# EasyEDA Pro project PET_LAB_PCB_Rev3.eprj, board PCB1
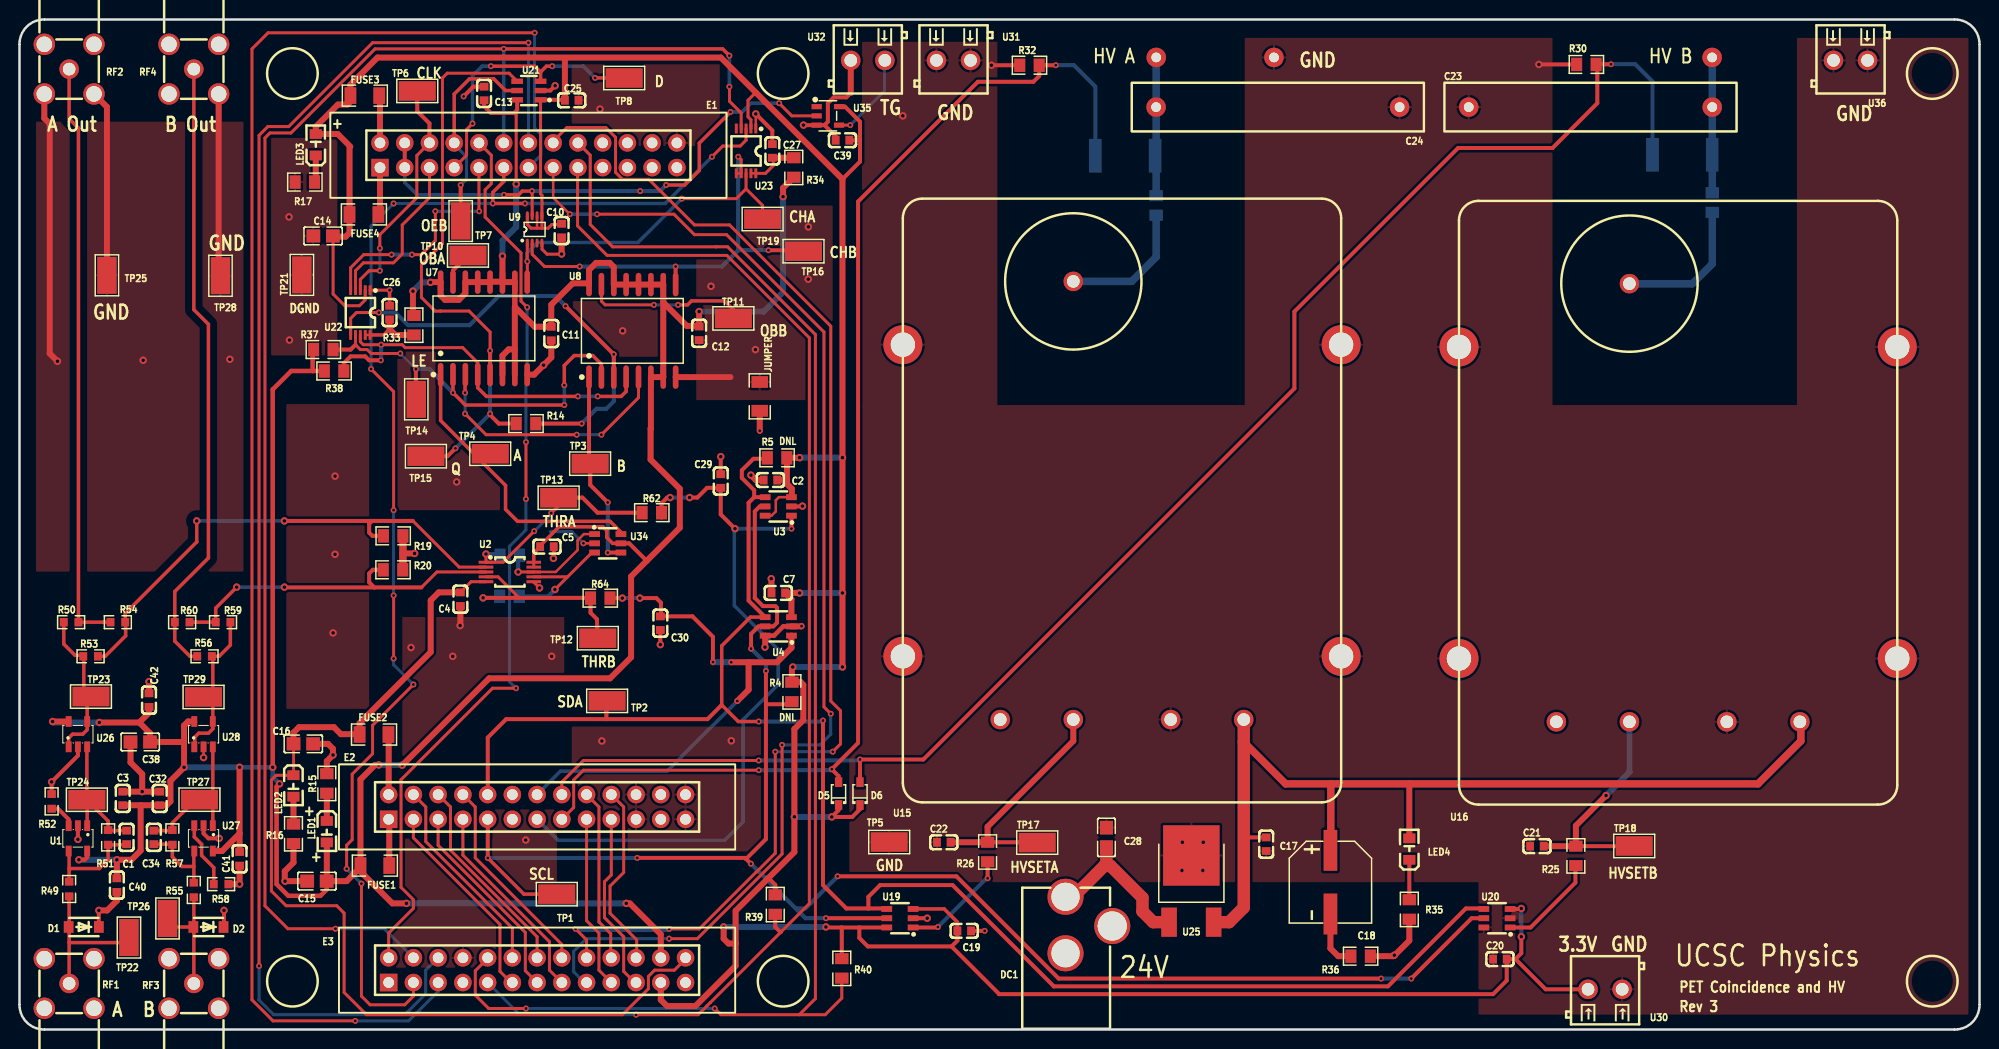
[diagram p4: board, top side]
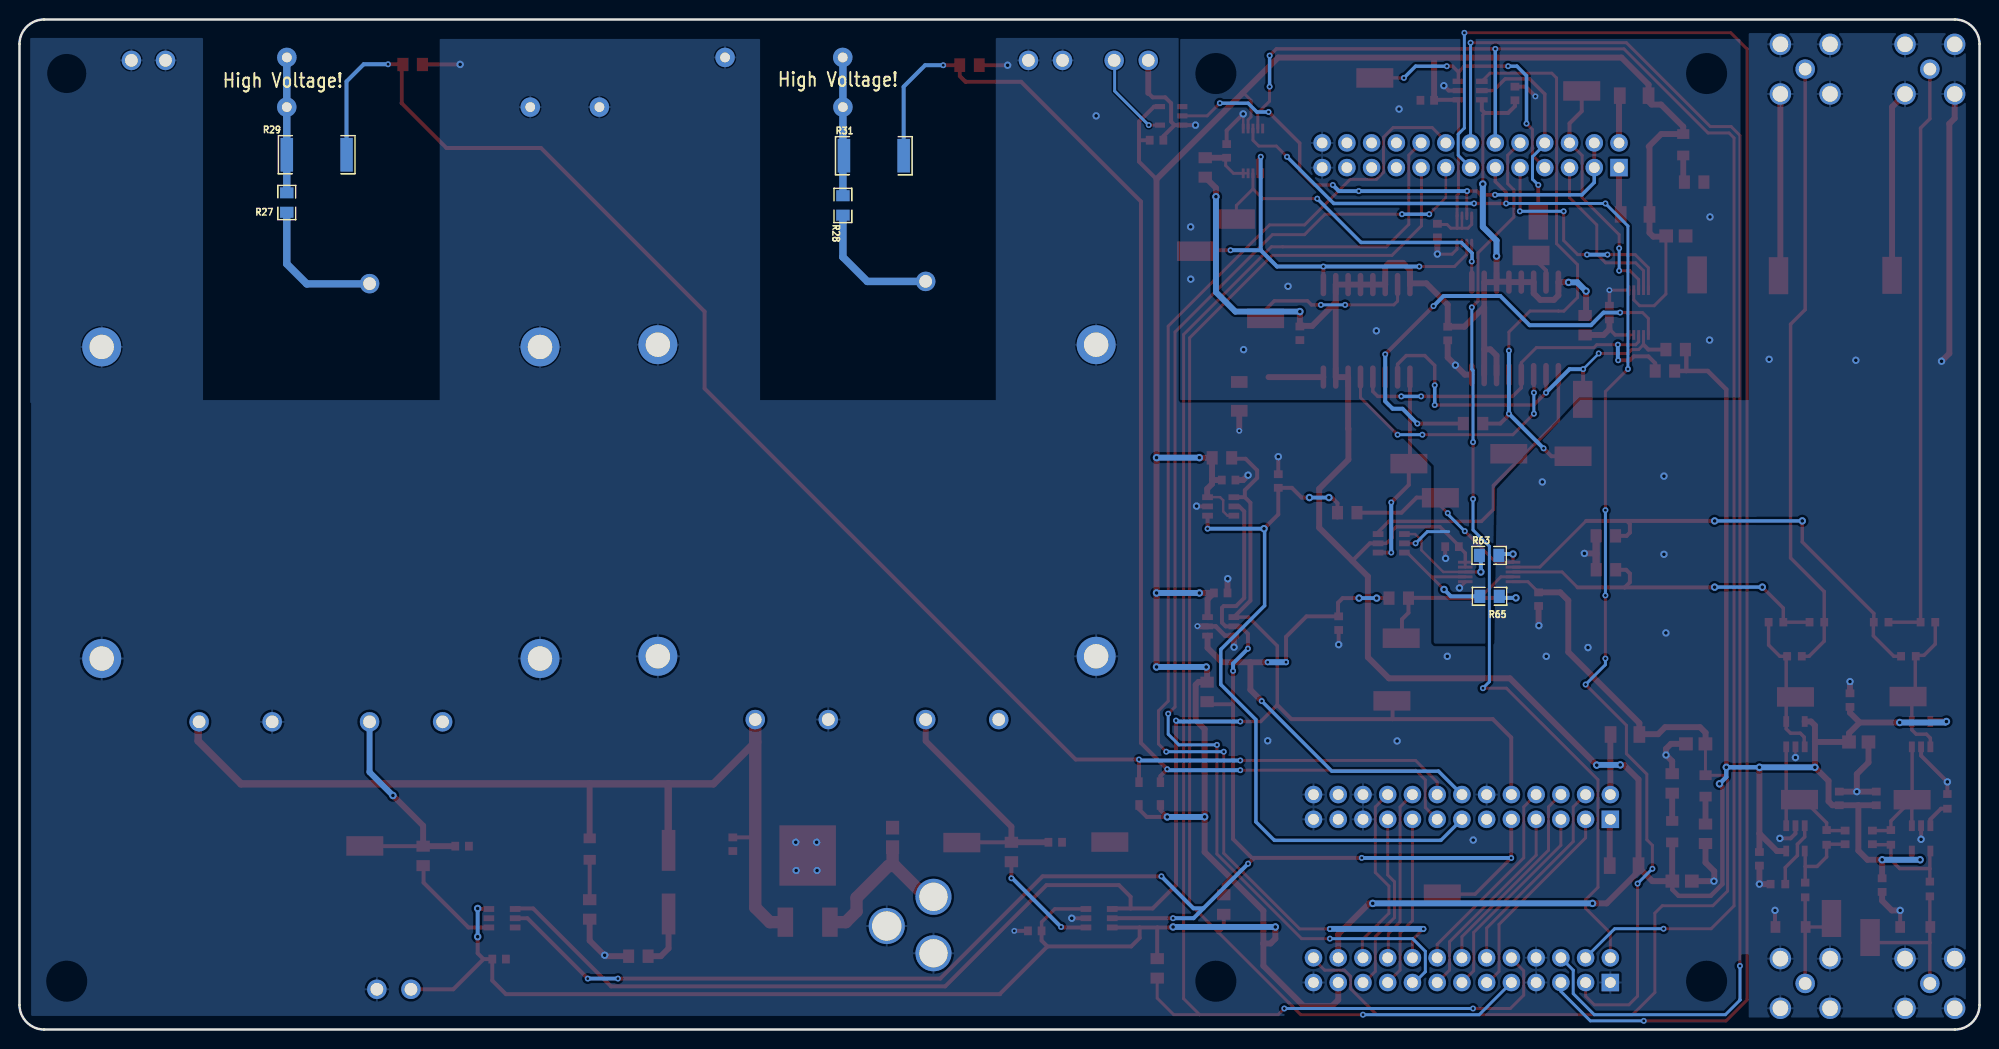
[diagram p5: board, bottom side, seen from below]

Outline 201.24 x 103.73 mm; copper layers: Top Layer, Bottom Layer. Coordinates in mm from the lower left corner of the outline.
Outline path: 0,101.19 arc(0.74,102.99) 2.54,103.73 198.7,103.73 arc(200.5,102.99) 201.24,101.19 201.24,2.54 arc(200.5,0.74) 198.7,0 2.54,0 arc(0.74,0.74) 0,2.54 0,101.19
Stack: Top Layer 0.035mm / Dielectric1 1.51mm FR4 er 4.5 / Bottom Layer 0.035mm

## Design rules (mm)
template: Custom Config
spacing copperThickness1oz (default): track to track 0.152, other pairs 0.152 to 0.3
spacing copperThickness2oz: track to track 0.203, other pairs 0.152 to 0.3
track width copperThickness1oz (default): min 0.127, default 0.254, max 2.54
track width copperThickness2oz: min 0.203, default 0.254, max 2.54
differential pair differentialPair (default): width min 0.127, default 0.254, max 2.54; gap min 0.152, default 0.152
via viaSize (default): diameter min 0.5, default 0.61, max 10; hole min 0.3, default 0.305, max 6.299
pour e4898 uses copperRegion

## Placement (name value [footprint] x y rotation side)
C1  5pF  [C0603]  11 19.73 90 top
C2  100nF  [C0603]  77.1 56.43 0 top
C3  100nF  [C0603]  10.6 23.73 90 top
C4  100nF  [C0603]  45.27 44.2 90 top
C5  100nF  [C0603]  54.16 49.59 180 top
C7  100nF  [C0603]  77.91 44.84 0 top
C10  100nF  [C0603]  55.66 82.05 270 top
C11  100nF  [C0603]  54.6 71.48 90 top
C12  100nF  [C0603]  69.78 71.5 90 top
C13  100nF  [C0603]  47.7 96.13 270 top
C14  1uF  [C0805]  31.18 81.5 0 top
C15  1uF  [C0805]  30.54 15.24 0 top
C16  1uF  [C0805]  29.14 29.34 180 top
C17  100nF  [C0603]  128 19.03 90 top
C18  220uF  [CAP-SMD_BD8.0-L8.3-W8.3-FD]  134.6 15.13 270 top
C19  100nF  [C0603]  97 10.13 180 top
C20  100nF  [C0603]  152 7.23 0 top
C21  100nF  [C0603]  155.8 18.83 0 top
C22  100nF  [C0603]  94.9 19.23 0 top
C23  0.068u  [HV_CAP_ECW-H12683JV]  161.3 94.73 0 top
C24  0.068u  [HV_CAP_ECW-H12683JV]  129.2 94.73 180 top
C25  100nF  [C0603]  56.7 95.43 180 top
C26  100nF  [C0603]  38 73.63 90 top
C27  100nF  [C0603]  77.3 90.23 270 top
C28  1uF  [C0805]  111.6 19.73 270 top
C29  100nF  [C0603]  72 56.33 270 top
C30  100nF  [C0603]  65.8 41.73 270 top
C32  100nF  [C0603]  14.4 23.73 270 top
C34  5pF  [C0603]  13.8 19.73 90 top
C38  1uF  [C0805]  12.4 29.53 0 top
C39  100nF  [C0603]  84.5 91.33 0 top
C40  100nF  [C0603]  10 14.83 270 top
C41  100nF  [C0603]  22.6 17.53 90 top
C42  100nF  [C0603]  13.3 33.83 270 top
D1  SM4007PL  [SOD-123F_L2.8-W1.8-LS3.7-RD]  6.6 10.53 180 top
D2  SM4007PL  [SOD-123F_L2.8-W1.8-LS3.7-RD]  19.4 10.53 180 top
D5  SS34  [SOD-323_L1.8-W1.3-LS2.5-RD]  84.1 24.23 90 top
D6  SS34  [SOD-323_L1.8-W1.3-LS2.5-RD]  86.3 24.23 90 top
DC1  694106301002  [DC-IN-TH_694106301002]  109.8 10.73 90 top
E1  3020-26-0100-00  [HDR-TH_26P-P2.54-V-M-R2-C13-S2.54]  52.26 89.79 0 top
E2  3020-26-0100-00  [HDR-TH_26P-P2.54-V-M-R2-C13-S2.54]  53.14 22.86 0 top
E3  3020-26-0100-00  [HDR-TH_26P-P2.54-V-M-R2-C13-S2.54]  53.14 6.1 0 top
FUSE1  0.5A  [R1206]  36.49 16.83 0 top
FUSE2  0.5A  [R1206]  36.4 30.3 180 top
FUSE3  0.5A  [R1206]  35.46 95.91 180 top
FUSE4  0.5A  [R1206]  35.36 83.71 0 top
JUMPER  3A  [R1206]  76 65.02 270 top
LED1  LG R971-KN-1-0-20-R18  [LED0805-RD_GREEN]  31.55 20.32 270 top
LED2  LG R971-KN-1-0-20-R18  [LED0805-RD_GREEN]  28.13 25.02 270 top
LED3  LG R971-KN-1-0-20-R18  [LED0805-RD_GREEN]  30.42 90.86 90 top
LED4  LG R971-KN-1-0-20-R18  [LED0805-RD_GREEN]  142.7 18.53 90 top
NOREF  -  [Pad_e1559]  128.8 99.83 0 top
NOREF#2  -  [Pad_e1592]  173.79 99.83 0 top
NOREF#3  -  [Pad_e1590]  116.72 99.83 0 top
R4  2.8kΩ  [R0805]  79.31 34.67 270 top
R5  2.8kΩ  [R0805]  77.78 58.71 180 top
R14  2.8kΩ  [R0805]  52 62.23 180 top
R15  330Ω  [R0805]  31.55 25.27 270 top
R16  330Ω  [R0805]  28.13 20.1 90 top
R17  330Ω  [R0805]  29.3 87.03 0 top
R19  50Ω  [R0805]  38.37 50.7 0 top
R20  50Ω  [R0805]  38.35 47.22 0 top
R25  2.8kΩ  [R0805]  159.8 17.83 90 top
R26  2.8kΩ  [R0805]  99.4 18.23 90 top
R27  1.5k  [R0805]  173.8 84.93 90 bottom
R28  1.5k  [R0805]  116.7 84.63 90 bottom
R29  10MegΩ  [R2512]  170.73 89.84 180 bottom
R30  10.2kΩ  [R0805]  160.88 99.11 0 top
R31  10MegΩ  [R2512]  113.53 89.74 180 bottom
R32  10.2kΩ  [R0805]  103.7 99.03 0 top
R33  2.8kΩ  [R0805]  40.5 72.33 270 top
R34  2.8kΩ  [R0805]  79.5 88.53 270 top
R35  1.5k  [R0805]  142.7 12.33 90 top
R36  0.5  [R0805]  137.7 7.53 180 top
R37  2.8kΩ  [R0805]  31.2 69.83 0 top
R38  2.8kΩ  [R0805]  32.3 67.63 0 top
R39  374  [R0805]  77.6 12.83 90 top
R40  374  [R0805]  84.43 6.28 270 top
R49  50Ω  [R0603]  5.1 14.43 90 top
R50  50Ω  [R0603]  5.3 41.83 0 top
R51  1kΩ  [R0603]  9.1 19.73 90 top
R52  50Ω  [R0603]  3.3 23.43 270 top
R53  50Ω  [R0603]  7.3 38.33 0 top
R54  50Ω  [R0603]  10.1 41.83 180 top
R55  50Ω  [R0603]  17.9 14.33 90 top
R56  50Ω  [R0603]  19 38.33 180 top
R57  1kΩ  [R0603]  15.7 19.73 90 top
R58  50Ω  [R0603]  20.7 14.93 180 top
R59  50Ω  [R0603]  20.9 41.83 180 top
R60  50Ω  [R0603]  16.7 41.83 180 top
R62  50Ω  [R0805]  64.92 53.08 180 top
R63  1.5k  [R0805]  50.35 48.69 180 bottom
R64  50Ω  [R0805]  59.63 44.31 180 top
R65  1.5k  [R0805]  50.31 44.49 0 bottom
RF1  -  [SMA-TH_BWSMA-KWE-Z001]  5.1 4.73 270 top
RF2  -  [SMA-TH_BWSMA-KWE-Z001]  5.1 98.63 90 top
RF3  -  [SMA-TH_BWSMA-KWE-Z001]  17.9 4.73 270 top
RF4  -  [SMA-TH_BWSMA-KWE-Z001]  17.9 98.63 90 top
TP1  5019  [CONN-SMD_5019]  55.16 13.9 180 top
TP2  5019  [CONN-SMD_5019]  60.33 33.75 0 top
TP3  5019  [CONN-SMD_5019]  58.59 58.12 0 top
TP4  5019  [CONN-SMD_5019]  48.34 59.13 0 top
TP5  5019  [CONN-SMD_5019]  89.29 19.25 180 top
TP6  5019  [CONN-SMD_5019]  40.84 96.39 0 top
TP7  5019  [CONN-SMD_5019]  45.3 83.03 90 top
TP8  5019  [CONN-SMD_5019]  62.09 97.72 180 top
TP10  5019  [CONN-SMD_5019]  46.05 79.49 0 top
TP11  5019  [CONN-SMD_5019]  73.3 73.03 0 top
TP12  5019  [CONN-SMD_5019]  59.38 40.19 0 top
TP13  5019  [CONN-SMD_5019]  55.36 54.61 0 top
TP14  5019  [CONN-SMD_5019]  40.74 64.72 90 top
TP15  5019  [CONN-SMD_5019]  41.73 58.88 0 top
TP16  5019  [CONN-SMD_5019]  80.5 79.93 0 top
TP17  5019  [CONN-SMD_5019]  104.49 19.2 0 top
TP18  5019  [CONN-SMD_5019]  165.79 18.85 0 top
TP19  5019  [CONN-SMD_5019]  76.3 83.23 0 top
TP21  5019  [CONN-SMD_5019]  28.99 77.5 90 top
TP22  5019  [CONN-SMD_5019]  11.24 9.45 90 top
TP23  5019  [CONN-SMD_5019]  7.34 34.19 0 top
TP24  5019  [CONN-SMD_5019]  6.92 23.6 0 top
TP25  5019  [CONN-SMD_5019]  8.98 77.45 90 top
TP26  5019  [CONN-SMD_5019]  15.2 11.41 90 top
TP27  5019  [CONN-SMD_5019]  18.48 23.61 0 top
TP28  5019  [CONN-SMD_5019]  20.64 77.41 90 top
TP29  5019  [CONN-SMD_5019]  18.9 34.15 0 top
U1  OPA354AIDBVT  [SOT-23-5_L3.0-W1.7-P0.95-LS2.8-BR]  6 19.63 90 top
U2  LT1715CMS#PBF  [MSOP-10_L3.0-W3.0-P0.50-LS5.0-TL]  50.35 46.99 0 top
U3  MCP4725A3T-E/CH  [SOT-23-6_L2.9-W1.6-P0.95-LS2.8-BR]  77.91 53.72 0 top
U4  MCP4725A3T-E/CH  [SOT-23-6_L2.9-W1.6-P0.95-LS2.8-BR]  77.91 41.4 0 top
U7  DS1023S-100+  [SOIC-16_L10.3-W7.5-P1.27-LS10.4-BL]  47.68 72.01 0 top
U8  DS1023S-100+  [SOIC-16_L10.3-W7.5-P1.27-LS10.4-BL]  62.92 71.76 0 top
U9  74LVC2G08DC,125  [VSSOP-8_L2.3-W2.0-P0.50-LS3.1-BL]  52.89 82.17 0 top
U15  C9619-50  [HPK_C9619-50]  113.2 54.33 90 top
U16  C9619-50  [HPK_C9619-50]  170.3 54.1 90 top
U19  MCP4725A0T-E/CH  [SOT-23-6_L2.9-W1.6-P0.95-LS2.8-BR]  90.4 11.43 0 top
U20  MCP4725A0T-E/CH  [SOT-23-6_L2.9-W1.6-P0.95-LS2.8-BR]  151.7 11.43 0 top
U21  TXU0101DBVR  [SOT-23-6_L2.9-W1.6-P0.95-LS2.8-BL-1]  52.3 96.43 90 top
U22  NVT2003DP,118  [TSSOP-10_L3.0-W3.0-P0.50-LS4.9-BL]  35 73.63 180 top
U23  NVT2003DP,118  [TSSOP-10_L3.0-W3.0-P0.50-LS4.9-BL]  74.6 90.23 180 top
U25  AS7815ADTR-G1  [TO-252-2_L6.6-W6.1-P4.57-LS9.9-BR-CW]  120.32 14.45 270 top
U26  OPA354AIDBVT  [SOT-23-5_L3.0-W1.7-P0.95-LS2.8-BR]  6 30.33 270 top
U27  OPA354AIDBVT  [SOT-23-5_L3.0-W1.7-P0.95-LS2.8-BR]  18.9 19.63 90 top
U28  OPA354AIDBVT  [SOT-23-5_L3.0-W1.7-P0.95-LS2.8-BR]  18.9 30.33 270 top
U30  OSTTE020104  [CONN-TH_2P-P3.50_OSTTE020104]  162.8 4.13 0 top
U31  OSTTE020104  [CONN-TH_2P-P3.50_OSTTE020104]  95.9 99.53 180 top
U32  OSTTE020104  [CONN-TH_2P-P3.50_OSTTE020104]  87.1 99.53 180 top
U34  SN74LVC2G04DBVT  [SOT-23-6_L2.9-W1.6-P0.95-LS2.8-BR]  60.4 49.93 180 top
U35  SN74LVC1G34DBVT  [TSOT-23-5_L2.9-W1.6-P0.95-LS2.8-BL]  83 93.83 270 top
U36  OSTTE020104  [CONN-TH_2P-P3.50_OSTTE020104]  188 99.53 180 top

## Footprints (pads in the part's own frame, mm; a bottom-side part is the same pattern mirrored in y, then rotated)
C0603
  rect 0.8x0.9 smd: 1(-0.7,0) 2(0.7,0)
C0805
  rect 1.41x1.35 smd: 1(-1,0) 2(1,0)
CAP-SMD_BD8.0-L8.3-W8.3-FD
  rect 4.2x1.4 smd: 1(-3.267,0) 2(3.267,0)
CONN-SMD_5019
  rect 3.8x2 smd: 1(0,0)
CONN-TH_2P-P3.50_OSTTE020104
  round 2 hole 1.3: 1(-1.75,0) 2(1.75,0)
DC-IN-TH_694106301002
  round 3.7 hole 2.9x3: 1(2.9,2.4) 2(-2.9,2.4)
  round 3.7 hole 3x2.9: 3(-0.1,-2.4)
HDR-TH_26P-P2.54-V-M-R2-C13-S2.54
  rect 1.8x1.8 hole 1.1: 1(-15.24,-1.27)
  round 1.8 hole 1.1: 2(-15.24,1.27) 3(-12.7,-1.27) 4(-12.7,1.27) 5(-10.16,-1.27) 6(-10.16,1.27) 7(-7.62,-1.27) 8(-7.62,1.27) 9(-5.08,-1.27) 10(-5.08,1.27) 11(-2.54,-1.27) 12(-2.54,1.27) 13(0,-1.27) 14(0,1.27) 15(2.54,-1.27) 16(2.54,1.27) 17(5.08,-1.27) 18(5.08,1.27) 19(7.62,-1.27) 20(7.62,1.27) 21(10.16,-1.27) 22(10.16,1.27) 23(12.7,-1.27) 24(12.7,1.27) 25(15.24,-1.27) 26(15.24,1.27)
HPK_C9619-50
  round 2 hole 1.3: 1(-22.5,-12.5) 2(-22.5,-5) 3(-22.5,5) 4(-22.5,12.5) 5(22.5,5)
  round 4 hole 2.5: 6(-16,-22.5) 7(16,-22.5) 8(-16,22.5) 9(16,22.5)
HV_CAP_ECW-H12683JV
  round 2 hole 1: 1(-12.5,0) 2(12.5,0)
LED0805-RD_GREEN
  rect 1x1.25 smd: 1(-1.1,0) 2(1.1,0)
MSOP-10_L3.0-W3.0-P0.50-LS5.0-TL
  rect 1.5x0.305 smd: 1(-2.451,1) 2(-2.451,0.5) 3(-2.451,0) 4(-2.451,-0.5) 5(-2.451,-1) 6(2.451,-1) 7(2.451,-0.5) 8(2.451,0) 9(2.451,0.5) 10(2.451,1)
Pad_e1559
  round 2 hole 1: 1(0,0)
Pad_e1590
  round 2 hole 1: 1(0,0)
Pad_e1592
  round 2 hole 1: 1(0,0)
R0603
  rect 0.806x0.864 smd: 1(-0.753,0) 2(0.753,0)
R0805
  rect 1.133x1.377 smd: 1(-1,0) 2(1,0)
R1206
  rect 1.208x1.701 smd: 1(-1.479,0) 2(1.479,0)
R2512
  rect 1.282x3.456 smd: 1(-3.067,0) 2(3.067,0)
SMA-TH_BWSMA-KWE-Z001
  round 2.2 hole 1.6: 1(-2.55,-2.55) 2(-2.55,2.55) 3(2.55,2.55) 4(2.55,-2.55)
  round 2 hole 1.3: 5(0,0)
SOD-123F_L2.8-W1.8-LS3.7-RD
  rect 1x1.2 smd: 1(-1.55,0) 2(1.55,0)
SOD-323_L1.8-W1.3-LS2.5-RD
  rect 1x0.75 smd: 1(-1.173,0) 2(1.173,0)
SOIC-16_L10.3-W7.5-P1.27-LS10.4-BL
  oval 0.574x2.401 smd: 1(-4.445,-4.75) 2(-3.175,-4.75) 3(-1.905,-4.75) 4(-0.635,-4.75) 5(0.635,-4.75) 6(1.905,-4.75) 7(3.175,-4.75) 8(4.445,-4.75) 9(4.445,4.75) 10(3.175,4.75) 11(1.905,4.75) 12(0.635,4.75) 13(-0.635,4.75) 14(-1.905,4.75) 15(-3.175,4.75) 16(-4.445,4.75)
SOT-23-5_L3.0-W1.7-P0.95-LS2.8-BR
  rect 1.1x0.6 smd: 1(1.3,-0.95) 2(1.3,0) 3(1.3,0.95) 4(-1.3,0.95) 5(-1.3,-0.95)
SOT-23-6_L2.9-W1.6-P0.95-LS2.8-BL-1
  rect 0.55x1.2 smd: 1(-0.95,-1.2) 2(0,-1.2) 3(0.95,-1.2) 4(0.95,1.2) 5(0,1.2) 6(-0.95,1.2)
SOT-23-6_L2.9-W1.6-P0.95-LS2.8-BR
  rect 1.1x0.6 smd: 1(1.35,-0.95) 2(1.35,0) 3(1.35,0.95) 4(-1.35,0.95) 5(-1.35,0) 6(-1.35,-0.95)
TO-252-2_L6.6-W6.1-P4.57-LS9.9-BR-CW
  rect 3x1.6 smd: 1(3.424,-2.29) 3(3.424,2.29)
  rect 6.2x5.8 smd: 2(-3.424,0)
TSOT-23-5_L2.9-W1.6-P0.95-LS2.8-BL
  rect 0.532x1.045 smd: 1(-0.95,-1.147) 2(0,-1.147) 3(0.95,-1.147) 4(0.95,1.147) 5(-0.95,1.147)
TSSOP-10_L3.0-W3.0-P0.50-LS4.9-BL
  rect 0.299x1 smd: 1(-1,-2.3) 2(-0.5,-2.3) 3(0,-2.3) 4(0.5,-2.3) 5(1,-2.3) 6(1,2.3) 7(0.5,2.3) 8(0,2.3) 9(-0.5,2.3) 10(-1,2.3)
VSSOP-8_L2.3-W2.0-P0.50-LS3.1-BL
  oval 0.305x0.905 smd: 1(-0.75,-1.403) 2(-0.25,-1.403) 7(-0.25,1.403) 8(-0.75,1.403)
  oval 0.28x0.905 smd: 3(0.25,-1.403) 4(0.75,-1.403) 5(0.75,1.403) 6(0.25,1.403)

## Nets
As in the schematic, except:
AGND: C2.1 C3.2 C4.1 C7.1 C15.1 C16.1 C17.1 C19.1 C20.1 C21.1 C22.1 C23.1 C24.1 C28.1 C29.1 C30.2 C32.1 C38.1 C40.2 C41.1 C42.1 D1.1 D2.1 DC1.2 DC1.3 E2.12 E2.21 E2.22 E2.25 E2.26 E3.1 E3.7 E3.8 E3.25 JUMPER.2 NOREF.1 R15.1 R16.1 R19.2 R20.2 R30.1 R32.1 R35.1 R36.1 R52.1 R58.1 RF1.1 RF1.2 RF1.3 RF1.4 RF2.1 RF2.2 RF2.3 RF2.4 RF3.1 RF3.2 RF3.3 RF3.4 RF4.1 RF4.2 RF4.3 RF4.4 TP5.1 TP25.1 TP28.1 U1.2 U3.2 U4.2 U4.6 U15.2 U15.6 U15.7 U15.8 U15.9 U16.2 U16.6 U16.7 U16.8 U16.9 U19.2 U20.2 U20.6 U25.2 U26.2 U27.2 U28.2 U30.2 U31.1 U31.2 U36.1 U36.2
HVOUTA: C24.2 NOREF#3.1 R28.2 R31.1
HVOUTB: C23.2 NOREF#2.1 R27.2 R29.1

Pads without a net: E1 19 20 21 22 23 24; E2 11 23 24; U9 3; U15 4; U16 4; U23 5; U35 1

## Via types
v1: diameter 0.762, hole 0.381, Top Layer to Bottom Layer, 100 vias
v2: diameter 0.61, hole 0.305, Top Layer to Bottom Layer, 114 vias

## Routing (per net, layer and track width the routed paths; a pad name or vN(x,y) marks a point on that pad's centre or on a via; arc(x,y) is an arc through that point)
AGND: length 147.1
  Top Layer w0.254: U28.2 v1(18.9,27.93)
  Top Layer w0.406: U26.2 6,28.13 v1(3.3,25.43) R52.1 ; R30.1 v1(156,99.11) ; D2.1 21,10.58 v1(21,12.23) ; C29.1 v1(72,58.83) ; C19.1 v2(99.1,10.13) ; D1.1 v1(8.15,12.23) ; R32.1 v1(99.79,99.03) ; v1(80.39,53.75) 80.36,53.72 U3.2 ; U1.2 v1(6,19.53) ; C30.2 v1(65.8,39.53) ; U27.2 18.9,20.13 19.4,19.63 v1(20.5,19.63) ; U19.2 v1(93.2,11.43)
  Top Layer w0.457: U4.6 77.47,40.45 78.42,41.4 U4.2
  Top Layer w0.61: v1(45.24,41.49) 45.27,41.52 C4.1 ; v1(3.9,68.63) 3.1,69.43 3.1,93.03 2.55,93.58 RF2.2 ; U4.2 80.27,41.4 v2(80.3,41.43) ; TP25.1 8.98,94.75 RF2.1 ; R58.1 v1(22.6,14.93) C41.1 ; v1(40.57,48.9) 39.41,48.9 39.37,48.85 ; C38.1 11.4,27.43 12.6,26.23 v1(12.6,24.43) ; v2(76,61.5) JUMPER.2 ; RF4.1 20.45,77.6 TP28.1 ; C16.1 31.68,29.34 32.19,28.83 v1(32.19,28.19) 31.55,27.56 R15.1 ; C42.1 v1(13.3,35.73) ; C7.1 77.21,46.27 v1(77.19,46.3) ; R36.1 141.06,7.53 v1(141.16,7.63) 141.2,7.63 142.7,9.13 R35.1 ; R16.1 28.13,17.15 27.24,16.26 27.24,15.27 v1(27.27,15.24) C15.1 ; C3.2 v1(12.6,24.43) ; v1(12.6,24.43) C32.1 ; U4.6 76.56,39.29 v1(76.54,39.27) ; 112,10.83 DC1.3 ; C40.2 10,13.23 9,12.23 v1(8.15,12.23) ; v1(75.1,56.93) 75.6,56.43 C2.1
  Top Layer w0.762: R19.2 39.37,47.23 R20.2
  vias: v1(12.7,68.73) v1(21.6,68.83) v1(32.2,40.73) v1(32.4,56.83) v1(32.4,48.81) v1(40.2,39.23) v1(44.48,38.33) v1(44.89,56.24) v1(51.98,19.46) v1(54.64,38.33) v1(59.8,29.63) v1(73.08,29.65) v1(90.7,93.83) v1(119.4,19.23) v1(119.36,16.33) v1(121.54,19.23) v1(121.5,16.33)
DGND: length 48
  Top Layer w0.254: U34.2 v2(57.9,49.93) ; v1(75.6,94.03) U23.1
  Top Layer w0.305: v2(38,75.93) U22.1 ; U9.4 53.65,80.75 53.65,80.14 54.16,79.63 55.65,79.63 v1(55.66,79.64) ; U2.6 52.8,45.94 v1(53.4,45.35)
  Top Layer w0.355: 38,74.53 v2(38,75.93)
  Top Layer w0.406: 82.65,92.88 83,93.23 83,95.13 83.6,95.73 84.9,95.73 85.35,96.18 ; 82.65,92.88 83.8,91.73 C39.1 ; 82.65,92.88 U35.3 v1(80.5,92.88) ; C27.1 77.3,92.33 v1(75.6,94.03) ; C5.1 54.86,48.42 v1(54.82,48.39) ; U21.2 54.5,96.43 v1(55,96.93) ; v2(45.6,95.83) 46.6,96.83 C13.1
  Top Layer w0.61: 52.13,67.26 52.84,67.26 v1(53.81,68.23) 54.6,69.02 54.6,70.77 C11.1 ; 85.35,96.18 U32.2 ; C10.2 v1(55.66,79.64) ; U8.8 73,67
  Bottom Layer w0.305: 54.5,51.13 56.7,51.13 v2(57.9,49.93)
  vias: v1(27.67,83.45) v1(27.72,70.81) v1(59.6,94.53) v1(61.93,71.76) v1(71,76.33) v1(75.56,69.82) v1(81,82.43) v1(80.99,77.06)
V3P3: length 385.9
  Top Layer w0.254: U3.3 77.97,54.67 77.66,54.36 77.66,53.21 77.21,52.77 U3.6 ; 53.64,85.67 53.65,85.68 ; U9.6 53.14,82.3 53.13,82.3
  Top Layer w0.305: U23.2 75.1,93.43 74.8,93.73 74.8,95.43 75.53,96.16 75.67,96.16 ; 53.63,82.3 52.52,82.3 52.14,82.68 U9.8 ; 53.63,82.3 53.64,82.31 U9.5 53.64,85.67 ; 53.63,82.3 54.29,82.3 54.67,82.68 55.59,82.68 C10.1 ; U21.1 53.5,85.83 53.65,85.68 ; 32.2,81.48 32.2,75.53 33.4,74.33 34.9,74.33 35.5,74.93 U22.2
  Top Layer w0.355: U19.3 91.75,12.38 94.95,12.38 96.3,11.03 C19.2
  Top Layer w0.406: R39.2 77.6,14.85 76.89,15.56 ; U30.1 156.7,4.13 153.6,7.23 ; v1(82.8,10.53) 82.85,10.48 84.41,10.48 ; C19.2 96.3,9.13 95.7,8.53 ; 84.41,10.48 84.43,10.46 R40.1 ; 84.41,10.48 86.23,10.48 ; 86.23,10.48 86.23,9.4 87.1,8.53 95.7,8.53 ; 86.23,10.48 U19.6 ; 84.5,87.33 86.3,89.13 86.3,91.34 ; 153.6,7.23 C20.2 152.7,5.03 151.3,3.63 100.57,3.63 100.57,3.66 95.7,8.53 ; 153.6,7.23 154.2,7.83 v1(154.2,9.53) ; U20.3 154.15,12.38 v1(154.2,12.43) ; U35.5 84.75,94.78 86.3,93.23 86.3,91.34 ; 86.3,91.34 86.29,91.33 C39.2 ; 84.1,23.16 84.1,22.53 v1(83.4,21.83) 85.5,21.83 86.3,22.63 86.3,23.16 ; U21.1 55.95,95.48
  Top Layer w0.61: C2.2 78.75,56.43 78.8,56.48 ; 79.3,54.71 79.3,55.53 78.8,56.03 78.8,56.48 ; 73.53,8.84 73.52,8.83 72.8,8.83 72.3,9.33 v1(72.3,10.53) ; 73.53,8.84 73.53,12.19 79.56,18.22 v1(79.56,21.84) 79.56,30.86 80.48,31.78 80.48,35.41 80.2,35.69 79.32,35.69 R4.1 79.31,37.08 ; 73.53,8.84 73.53,6.54 69.4,2.41 66.48,2.41 65.84,3.05 E3.23 ; 78.8,56.48 78.8,58.59 ; 33.89,90.68 33.89,81.82 33.5,81.43 32.24,81.43 C14.2 ; C25.2 56,99.63 ; U4.3 79.26,44.19 C7.2 80.09,44.84 v1(80.1,44.83) ; 33.97,90.68 32.68,91.96 LED3.2 30.42,92.72 32.7,95 33.67,95 33.98,95.31 33.98,97.04 36.76,99.82 72.01,99.82 84.5,87.33 v1(84.5,58.73) v1(84.5,44.83) v1(84.5,37.23) ; R5.1 80.08,58.71 v1(80.1,58.73)
  Bottom Layer w0.406: v1(154.2,12.43) v1(154.2,9.53)
  Bottom Layer w0.61: v1(84.5,58.73) v1(80.1,58.73) ; v1(84.5,37.23) v1(79.4,37.23) ; v1(84.5,44.83) v1(80.1,44.83) ; v1(79.56,21.84) 79.57,21.83 v1(83.4,21.83) ; v1(82.8,10.53) v1(72.3,10.53)
V4N: length 104.6
  Top Layer w0.305: U2.5 46.36,45.99 C4.2 ; E3.26 68.38,7.24 67.24,6.1 65.21,6.1 64.57,5.46 64.57,4.19 61.91,1.52 35.62,1.52 33.33,3.81 33.33,11.95 32.57,12.71 27.38,12.71 25.87,14.22 25.87,25.63 26.34,26.11 28.13,26.11 28.14,26.12 C16.2
  Top Layer w0.61: 45.27,44.89 43.05,44.89 42.22,44.07 42.22,38.77 34.92,31.47 FUSE2.2 ; 34.82,30.3 34.79,30.33 33,30.33 32.28,31.05 28.7,31.05 28.13,30.48 28.13,29.35 C16.2
V5: length 384.4
  Top Layer w0.305: 50.8,94.13 51,93.93 v1(51,86.83) ; U2.9 U2.10
  Top Layer w0.355: 53.46,49.59 52.8,48.94 U2.10 ; 53.46,49.69 55.4,51.63 59.9,51.63 60.3,51.23 60.3,50.53 60.9,49.93 U34.5
  Top Layer w0.406: v1(6.1,17.43) 6.7,17.43 6.95,17.68 U1.5 ; U21.6 51.1,94.43 50.8,94.13 48.4,94.13 47.7,94.83 C13.2 ; U34.5 62.6,49.93 64.4,48.13
  Top Layer w0.457: 30.1,67.63 30.1,69.73 R37.1 ; 30.1,67.63 R38.1 ; 30.1,67.63 27.9,67.63 26,65.73 v1(26,26.93) ; v1(26.7,25.23) 26.4,24.93 26.4,14.93 27.6,13.73 30.9,13.73 31.54,14.37 C15.2
  Top Layer w0.559: U7.10 50.86,74.17
  Top Layer w0.61: 12.44,23.03 C32.2 15.1,23.03 15.5,23.43 15.5,25.53 v1(16.9,26.93) 16.9,29.56 ; 12.44,23.03 12.44,18.37 11.5,17.43 v1(10,17.43) C40.1 ; 12.44,23.03 C3.1 ; 69.65,72.33 69.72,72.26 68.51,72.26 66.1,74.68 ; 22.6,20.13 C41.2 ; 22.6,20.13 v1(22.6,26.93) ; 22.6,20.13 20.8,18.33 U27.5 ; U7.11 49.55,76.8 48.36,76.8 U7.12 U7.13 U7.14 45.78,75.61 45.1,74.93 43.7,74.93 43.24,75.39 U7.16 42.23,76.76 v1(42.2,76.73) ; U7.11 U7.10 ; U7.11 v1(49.59,79.43) ; 66.1,74.68 66.1,76.51 U8.11 U8.12 U8.13 U8.14 61.02,78.31 60.6,78.73 59.2,78.73 58.48,78.01 U8.16 58.35,76.63 56.8,76.63 54.6,74.43 C11.2 52.89,72.18 50.88,74.19 50.86,74.17 U7.7 ; 66.1,74.68 66.1,67 U8.6 64.83,61.73 64.8,61.7 64.8,58.53 67.8,55.53 67.8,51.54 62.8,46.53 62.8,38.23 60.64,36.07 48.22,36.07 v1(39.3,27.15) ; U7.6 49.59,69.22 50.22,69.85 50.86,69.85 ; 16.9,29.56 16.9,31.23 17.3,31.63 U28.5 ; 16.9,29.56 16.87,29.53 C38.2 13.4,30.43 12.3,31.53 ; v1(3.4,31.63) U26.5 ; E3.24 65.84,9.78 62.67,12.95 v1(62.3,12.95) ; 34.92,16.57 33.59,15.24 C15.2 31.55,15.26 LED1.2 ; 12.3,31.53 13.3,32.53 C42.2 ; 12.3,31.53 v1(8.2,31.53) ; C12.2 v1(69.78,73.73) ; v1(39.73,12.95) 38.29,12.95 35.01,16.23 FUSE1.1 ; v1(36.89,27.18) 36.51,27.18 35.01,25.68 35.01,17.33 ; v1(40.4,75.83) 40.4,73.43 R33.1 ; R34.2 78.4,86.43 v1(78.4,85.53)
  Bottom Layer w0.457: v1(22.6,26.93) v1(26,26.93) 26,25.93 v1(26.7,25.23)
  Bottom Layer w0.61: v1(10,17.43) v1(6.1,17.43) ; v1(8.2,31.53) 3.5,31.53 v1(3.4,31.63) ; v1(42.2,76.73) 41.3,76.73 v1(40.4,75.83) ; v1(49.59,79.43) 49.59,81.02 51,82.43 v1(51,86.83) ; v1(39.3,27.15) 39.27,27.18 v1(36.89,27.18) ; v1(16.9,26.93) 22.5,26.93 22.6,26.83 ; v1(78.4,85.53) 78.4,75.73 76.4,73.73 v1(69.78,73.73) ; v1(39.73,12.95) v1(62.3,12.95)
V15: length 100.3
  Top Layer w0.406: C17.2 126,19.73
  Top Layer w0.61: LED4.2 142.7,25.2 142.73,25.23
  Top Layer w0.762: 134.64,25.23 134.64,18.44 C18.1 ; 134.64,25.23 130,25.23 125.7,29.53 ; 134.64,25.23 178.5,25.23 182.9,29.63 182.9,31.5 U16.1
  Top Layer w1.27: U15.1 125.7,12.53 124.19,11.03 U25.3
AIN2: length 130.7
  Top Layer w0.305: E2.15 56.9,22.81 56.9,25.63 57.9,26.63 v2(75.9,26.63)
  Top Layer w0.406: v2(106.4,99.03) R32.2 104.7,97.93 104.1,97.33 98.4,97.33 86.1,85.03 86.1,29.43 v2(83.4,26.73) 84.1,26.03 84.1,25.5
  Bottom Layer w0.406: v2(106.4,99.03) 108.26,99.03 110.46,96.83 110.46,90.24 ; v2(75.9,26.63) 83.3,26.63 v2(83.4,26.73)
AIN3: length 161.6
  Top Layer w0.305: E2.16 55.68,25.42 57.9,27.63 v2(75.9,27.63)
  Top Layer w0.406: v2(163.4,99.13) 161.9,99.13 R30.2 162,98.99 162,95.13 157.4,90.53 147.7,90.53 130.9,73.73 130.9,65.83 92.8,27.73 v2(86.3,27.73) 86.3,25.5
  Bottom Layer w0.406: 167.66,89.64 167.66,97.37 165.9,99.13 v2(163.4,99.13) ; v2(75.9,27.63) 86.2,27.63 v2(86.3,27.73)
AOUT0: length 17.8
  Top Layer w0.305: E2.17 58.22,11.18 59.49,9.91 59.49,6.1 E3.19
AOUT1: length 17.8
  Top Layer w0.305: E2.18 59.49,22.86 59.49,11.05 60.7,9.84 60.7,7.43 E3.20
AOUT2: length 18.5
  Top Layer w0.305: E3.21 63.18,4.83 62.03,5.97 62.03,9.53 60.07,11.49 60.07,15.18 60.76,15.88 E2.19
AOUT3: length 19
  Top Layer w0.305: E2.20 62.03,22.86 62.03,16.13 60.64,14.73 60.64,11.94 63.37,9.21 63.37,7.43 E3.22
CLK: length 40.2
  Top Layer w0.305: U22.8 35,70.63 35.3,70.33 v2(37.13,70.33) 39.3,70.33 39.6,70.03 45.5,70.03 47.05,68.48 U7.4
  Top Layer w0.355: v2(57.34,65.02) 47.94,65.02 47.05,65.91 U7.4 ; U8.4 62.29,65.53 61.78,65.02 v2(59.37,65.02)
  Top Layer w0.406: v2(37.1,68.73) 35.9,68.73 35.5,69.13 34,69.13 33.3,68.43 R38.2
  Bottom Layer w0.355: v2(57.34,65.02) v2(59.37,65.02)
  Bottom Layer w0.406: v2(37.1,68.73) 37.13,68.76 v2(37.13,70.33)
CS: length 21
  Top Layer w0.305: E3.14 53.14,9.53 44.25,18.41 44.25,22.86 E2.6
D: length 28.1
  Top Layer w0.305: E1.7 45.91,89.79 45.91,92.44 v2(46.51,93.05)
  Top Layer w0.355: TP8.1 62.08,97.73 v2(59.1,97.73) ; v2(48.4,98.93) 52.9,98.93 53.5,98.33 ; v2(54.7,98.93) 54.1,98.93 53.5,98.33 ; 53.5,98.33 U21.3
  Bottom Layer w0.355: v2(54.7,98.93) 57.9,98.93 v2(59.1,97.73) ; v2(48.4,98.93) 47.5,98.93 46.51,97.95 v2(46.51,93.05)
GPIO10: length 95.2
  Top Layer w0.305: E3.2 37.9,9.91 40.44,12.45 40.44,13.34 39.17,14.61 39.17,25.65 48.57,35.05 v2(50.99,35.05) ; v2(52,54.48) v2(52,60.33) ; E1.10 48.45,89.79 48.45,86.87 47.81,86.23 47.81,83.44 51.49,79.76 51.49,74.8 v2(52.13,74.17)
  Bottom Layer w0.305: v2(52,54.48) 52,51.31 50.32,49.63 50.32,35.71 v2(50.99,35.05) ; v2(52.13,74.17) 52.13,67.82 52,67.69 v2(52,60.33)
GPIO11: length 139.3
  Top Layer w0.305: v2(38.41,44.58) v2(38.41,38.1) ; v2(40.44,35.43) 36.25,31.24 36.25,28.32 34.16,26.23 34.16,19.49 33.59,18.92 v2(33.59,16.51) ; U23.3 74.6,91.33 74,90.73 72.2,90.73 v2(71.1,89.63) ; v2(35.11,14.99) 35.11,3.43 36,2.54 39.56,2.54 40.44,3.43 E3.3 ; v2(36.1,67.83) 38.41,65.52 v2(38.41,53.34)
  Top Layer w0.355: v2(51.9,84.84) v2(48.6,84.84) 48.6,85.97 49.72,87.09 E1.11
  Bottom Layer w0.305: v2(40.44,35.43) 38.41,37.47 v2(38.41,38.1) ; v2(33.59,16.51) v2(35.11,14.99) ; v2(48.6,84.84) v2(38.41,84.84) 36.1,82.52 v2(36.1,67.83) ; v2(38.41,53.34) v2(38.41,44.58)
  Bottom Layer w0.355: v2(71.1,89.63) 66.3,84.84 v2(51.9,84.84)
GPIO12: length 165.7
  Top Layer w0.305: U23.4 74.1,94.13 72.9,95.33 72.9,96.82 v2(72.89,96.83) ; v2(32.44,10.35) 27.55,10.35 25.2,12.7 25.2,91.57 25.71,92.08 27.87,92.08 36.51,100.71 v2(49.72,100.71)
  Top Layer w0.355: v2(49.72,100.71) 72.2,100.71 v2(72.89,100.02)
  Bottom Layer w0.305: E3.4 37.46,10.35 v2(32.44,10.35)
  Bottom Layer w0.355: E1.12 v2(49.72,100.71) ; v2(72.89,100.02) v2(72.89,96.83)
GPIO13: length 164.2
  Top Layer w0.305: v2(52.89,102.36) 25.52,102.36 23.87,100.71 23.87,3.05 26.03,0.89 v2(34.48,0.89)
  Bottom Layer w0.305: E3.5 42.98,3.92 39.96,0.89 v2(34.48,0.89) ; E1.13 53.53,89.79 53.53,91.95 52.89,92.58 v2(52.89,102.36)
GPIO14: length 153.6
  Top Layer w0.305: v2(24.6,6.53) 24.6,91.83 25.5,92.73 27.64,92.73 36.25,101.35 v2(52.26,101.35)
  Bottom Layer w0.305: E3.6 41.71,6.1 41.71,3.68 39.56,1.52 26.09,1.52 24.57,3.05 24.6,3.08 v2(24.6,6.53) ; E1.14 v2(52.26,101.35)
GPIO15: length 124.3
  Top Layer w0.254: E1.15 54.8,85.44 v2(56.5,83.73)
  Top Layer w0.305: v2(78.3,29.23) 78.3,18.03 69.6,9.33 v2(66.7,9.33) ; v2(83.3,32.43) 82.6,33.13 82.6,71.63 72.6,81.63 69.3,81.63 67.2,83.73 v2(59.3,83.73)
  Bottom Layer w0.305: E3.17 58.01,4.83 56.9,5.93 56.9,8.03 58.2,9.33 v2(66.7,9.33) ; v2(78.3,29.23) 82.2,29.23 83.3,30.33 v2(83.3,32.43)
  Bottom Layer w0.355: v2(59.3,83.73) v2(56.5,83.73)
GPIO16: length 127.7
  Top Layer w0.305: v2(57.1,10.33) 58.22,9.21 E3.18 ; E1.16 54.8,91.23 56.2,92.63 60.2,92.63 61.2,91.63 61.2,88.03 61.92,87.31 64.62,87.31 69.3,82.63 72.9,82.63 83.3,72.23 83.3,33.73 84.3,32.73 84.3,29.33 v2(83.5,28.53) ; v2(66.7,10.33) 69.8,10.33 75.62,16.15 75.64,16.15 77.6,18.11 v2(77.6,28.53)
  Bottom Layer w0.305: v2(83.5,28.53) v2(77.6,28.53)
  Bottom Layer w0.61: v2(66.7,10.33) v2(57.1,10.33)
GPIO17: length 133.9
  Top Layer w0.305: v2(63.3,1.52) 69.69,1.52 70.57,2.4 70.57,2.41 70.93,2.77 70.94,2.77 78.16,9.99 81.1,12.93 81.1,71.03 72.63,79.5 60.33,79.5 57.3,82.53 57.3,88.48 E1.17
  Top Layer w0.406: 78.16,9.99 78.14,9.99 77.6,10.53 R39.1
  Bottom Layer w0.305: E3.9 51.37,1.52 v2(63.3,1.52)
GPIO18: length 152.8
  Top Layer w0.305: R40.2 84.43,3.22 82.73,1.52 80.07,1.52 ; E1.18 58.6,89.8 58.6,82.68 60.9,80.38 71.55,80.38 71.55,80.39 72.7,80.39 81.72,71.37 81.72,3.18 80.07,1.52 ; v2(71.38,2.16) 72.01,1.52 80.07,1.52 ; v2(52,2.16) 48.17,2.16 46.8,3.53 46.8,6.03 48.06,7.3 E3.10
  Bottom Layer w0.305: v2(71.38,2.16) v2(52,2.16)
HVOUTA: length 13.9
  Bottom Layer w0.762: R31.1 116.7,89.64 R28.2 ; 116.7,90.13 C24.2 116.7,99.81 NOREF#3.1
HVOUTB: length 13.8
  Bottom Layer w0.762: R27.2 173.8,89.84 R29.1 ; NOREF#2.1 173.8,99.82 C23.2 173.8,89.93
INA: length 53.2
  Top Layer w0.305: 40.4,52.23 45.14,47.49 U2.2
  Top Layer w0.355: v1(18.2,52.23) 18.2,50.08 10.85,42.73 R54.1 10.9,41.79 10.9,40.43 8.8,38.33 R53.2
  Top Layer w0.406: 36.2,52.23 40.4,52.23 ; 36.2,52.23 35.9,51.93 35.9,51.03 36.23,50.7 R19.1 ; 36.2,52.23 v1(27.2,52.23)
  Bottom Layer w0.355: v1(18.2,52.23) v1(27.2,52.23)
INB: length 36.7
  Top Layer w0.305: U2.3 42.86,46.99 41.27,45.4
  Top Layer w0.355: v1(22.3,45.43) 20.15,43.28 R59.2 R60.1
  Top Layer w0.406: 41.27,45.4 36.43,45.4 ; 36.43,45.4 35.9,45.93 35.9,46.83 36.28,47.22 R20.1 ; 36.43,45.4 27.23,45.4 v1(27.2,45.43)
  Bottom Layer w0.355: v1(22.3,45.43) v1(27.2,45.43)
LE: length 42.5
  Top Layer w0.305: v2(39.1,69.43) 36.1,69.43 35.7,69.83 35,69.83 34.5,70.33 U22.7
  Top Layer w0.355: v2(55.94,66.17) 55.94,68.2 56.95,69.22 58.86,69.22 59.75,68.33 U8.2 ; v2(55.94,64.14) 45.78,64.14 v2(44.51,65.41) U7.2
  Top Layer w0.406: 34.5,70.33 34,69.83 R37.2 ; v2(40.7,67.82) 40.7,64.76 TP14.1
  Bottom Layer w0.254: v2(39.1,69.43) 39.1,69.42 v2(40.7,67.82)
  Bottom Layer w0.355: v2(55.94,64.14) v2(55.94,66.17)
  Bottom Layer w0.406: v2(44.51,65.41) 42.1,67.82 v2(40.7,67.82)
MISO: length 21
  Top Layer w0.305: E3.12 50.6,10.41 41.71,19.3 41.71,22.86 E2.4
MOSI: length 21
  Top Layer w0.305: E3.11 50.48,4.83 49.33,5.97 49.33,10.8 40.44,19.69 E2.3
OEB: length 21.3
  Top Layer w0.355: U21.5 49.9,96.43 48.7,97.63 46.2,97.63 44.64,96.07 E1.8
  Top Layer w0.406: 45.3,83.13 v2(45.3,86.73)
  Bottom Layer w0.305: E1.8 44.64,90.9 45.9,89.63 45.9,87.33 v2(45.3,86.73)
Q: length 49.4
  Top Layer w0.305: U22.6 34,73.03 34.6,73.63 v2(36.9,73.63)
  Top Layer w0.406: v2(56.06,74.3) v2(61.02,69.34) U8.3 ; R14.1 v2(57.72,62.23)
  Bottom Layer w0.406: v2(56.06,74.3) 55.03,75.33 49.2,75.33 46.2,72.33 39.9,72.33 38.6,73.63 v2(36.9,73.63) ; v2(61.02,69.34) 61.02,64.52 60.26,63.75 59.24,63.75 v2(57.72,62.23)
RX: length 21
  Top Layer w0.305: E3.16 55.68,8.74 46.79,17.63 46.79,22.86 E2.8
SCK: length 21
  Top Layer w0.305: E3.13 51.94,6.03 51.94,9.97 42.98,18.92 E2.5
SCL: length 180
  Top Layer w0.355: v2(48.08,17.62) 51.8,13.9 TP1.1
  Top Layer w0.406: 76.64,33.41 79.04,33.41 R4.2 ; 76.64,33.41 v2(76.64,36.83) ; 76.64,33.41 76.64,19.56 74.6,17.52 ; E2.9 48.08,21.57 v2(48.08,17.62) ; 74.6,17.52 75.09,17.03 v2(75.1,17.03) ; 74.6,17.52 74.6,17.53 74.51,17.63 v2(63.43,17.63) ; v2(139.8,5.23) 106.7,5.23 96.2,15.73 v2(84,15.73) ; v2(142.9,5.23) 149.1,11.43 U20.5 ; U19.5 89.05,11.43 v2(82.8,11.43) ; U3.5 76,53.72 75.5,53.21 75.5,44.32 76.33,43.49 77.6,43.49 77.78,43.31 77.78,41.78 77.4,41.4 U4.5 75.88,41.4 75.12,40.64 v2(75.12,39.12)
  Bottom Layer w0.406: 79.69,12.44 80.71,12.44 v2(84,15.73) ; 79.69,12.44 v2(75.1,17.03) ; 79.69,12.44 80.7,11.43 v2(82.8,11.43) ; v2(76.64,36.83) 76.64,37.59 v2(75.12,39.12) ; v2(139.8,5.23) v2(142.9,5.23) ; v2(63.43,17.63) 63.42,17.62 v2(48.08,17.62)
SDA: length 173.9
  Top Layer w0.305: E2.10 48.08,24.15
  Top Layer w0.355: v2(75.9,31.63) 73.8,31.63 72.1,33.33 72.1,39.4 75.05,42.35 76.56,42.35
  Top Layer w0.406: U3.4 76.56,54.67 75.43,54.67 ; 87.16,12.43 87.16,13.63 88.36,14.83 95.8,14.83 106.2,4.43 140.5,4.43 148.5,12.43 150.3,12.43 U20.4 ; 87.16,12.43 84.9,12.43 82.5,14.83 v2(82.5,31.73) ; 87.16,12.43 89,12.43 U19.4 ; 75.43,54.67 75.43,55.39 74.17,56.65 74.17,57.43 75.35,58.62 76.69,58.62 R5.2 ; 75.43,54.67 74.86,54.1 74.86,44.05 76.56,42.35 ; 72.1,33.33 70.64,31.88 60.26,31.88 ; 60.26,31.88 60.26,33.68 TP2.1 ; 60.26,31.88 49.97,31.88 48.08,29.99 48.08,24.15
  Bottom Layer w0.406: v2(82.5,31.73) 82.4,31.63 v2(75.9,31.63)
THRESHAP: length 76
  Top Layer w0.406: U3.1 v2(79.26,51.44) ; 65.92,52.58 65.92,52.58 ; R62.1 65.92,54.05 66.5,54.63 v1(66.8,54.63) ; v1(73.46,51.44) 72,52.9 C29.2 70.6,55.63 69.6,54.63 v1(68.8,54.63)
  Bottom Layer w0.355: v1(73.46,51.44) 73.4,51.37 73.4,43.53 77.9,39.03 77.9,35.43 74.3,31.83 74.3,21.33 72.4,19.43 55.3,19.43 E2.13
  Bottom Layer w0.406: v1(68.8,54.63) v1(66.8,54.63) ; v2(79.26,51.44) v1(73.46,51.44)
THRESHBP: length 54.7
  Top Layer w0.406: v2(71.2,37.73) 71.2,40.33 69.1,42.43 C30.1 65.86,42.49 65.86,43.83 65.39,44.31 v1(63.7,44.31) ; v1(61.9,44.31) R64.1
  Top Layer w0.61: U4.1 79.26,39.2 77.78,37.72 74.86,37.72 ; 74.86,37.72 74.86,34.9 v2(73.7,33.73) ; 74.86,37.72 v2(73.08,37.72)
  Bottom Layer w0.355: v2(73.7,33.73) 66.5,26.53 55.55,26.53 E2.14
  Bottom Layer w0.406: v1(63.7,44.31) v1(61.9,44.31)
  Bottom Layer w0.61: v2(71.2,37.73) 71.21,37.72 v2(73.08,37.72)
TRIGGER: length 55.5
  Top Layer w0.305: U35.2 79.3,93.83 v2(78,95.13) ; v2(52.61,86.11) 52.64,86.08 U9.7
  Top Layer w0.355: v2(52.61,86.11) 51.62,86.11 51.24,85.73 v2(49.75,85.73) ; v2(66.4,86.73) 68.3,86.73 69.8,88.23 69.8,91.03 v2(73,94.23)
  Top Layer w0.406: E1.3 E1.4
  Bottom Layer w0.355: v2(73,94.23) 74.2,94.23 75.1,95.13 v2(78,95.13) ; v2(49.75,85.73) 40.83,85.73 39.56,87 E1.3
  Bottom Layer w0.406: v2(52.61,86.11) v2(63.74,86.11) 65.77,86.11 v2(66.4,86.73)
TX: length 21
  Top Layer w0.305: E2.7 45.52,17.91 54.41,9.02 54.41,6.1 E3.15
$1N1458: length 35.5
  Top Layer w0.305: U9.1 v2(52.14,78.88) 52.14,76.77 52.13,76.76 ; TP19.1 76.3,84.63 74.6,86.33 ; v2(68,85.33) 73.6,85.33 74.6,86.33 ; 74.6,86.33 U23.8
  Bottom Layer w0.355: v2(52.14,78.88) 52.1,78.92 52.1,79.73 53.2,80.83 63.5,80.83 v2(68,85.33)
$1N1466: length 44
  Top Layer w0.305: v2(57.52,78.36) 53.91,78.36 52.64,79.62 U9.2 ; v2(73.8,89.63) 74.1,89.33 U23.7 U23.6
  Top Layer w0.406: v2(67.37,78.36) U8.9 ; v2(76.9,80.03) 80.4,80.03 TP16.1
  Bottom Layer w0.406: 73.8,80.03 v2(73.8,89.63) ; 73.8,80.03 v2(76.9,80.03) ; 73.8,80.03 72.13,78.36 v2(67.37,78.36) v2(57.52,78.36)
$1N4776: length 62.6
  Top Layer w0.305: v2(48.32,69.72) 48.32,71.63 46.16,73.79 43.24,73.79 43.23,73.78 42.67,73.78 41.27,75.18 41.27,78.55 43.43,80.71 43.43,97.73 43.92,98.21 50.27,98.21 U21.4
  Top Layer w0.406: v2(48.32,63.25) 48.32,63.12 49.21,62.23 R14.2 ; v2(44.76,59.69) 43.95,58.88 TP15.1 ; v2(48.32,69.72) 48.32,67.26
  Bottom Layer w0.406: v2(44.76,59.69) v2(48.32,63.25) v2(48.32,69.72)
$1N4823: length 26.4
  Top Layer w0.305: v2(59.75,61.09) 63.56,64.9 U8.5 ; v2(45.75,63.25) 47.91,61.09 v2(57.21,61.09)
  Top Layer w0.355: v2(45.75,65.41) 45.75,67.23 U7.3
  Bottom Layer w0.305: v2(59.75,61.09) v2(57.21,61.09) ; v2(45.75,63.25) v2(45.75,65.41)
$1N8755: length 3.4
  Top Layer w0.406: TP10.1 44.51,77.95 U7.15
$1N8787: length 16.9
  Top Layer w0.305: U8.15 59.75,74.8 60.13,74.42 v2(65.14,74.42)
  Top Layer w0.355: TP11.1 73.3,73.93 72.4,74.83 69,74.83 68.59,74.42 v2(67.62,74.42)
  Bottom Layer w0.305: v2(65.14,74.42) v2(67.62,74.42)
$1N21446: length 5.7
  Top Layer w0.254: U23.9 U23.10
  Top Layer w0.305: U23.10 76.6,87.93 77.4,88.73 77.4,89.43 C27.2
  Top Layer w0.61: R34.1 C27.2
$1N39256: length 29.6
  Top Layer w0.305: 61.75,51.08 U34.6
  Top Layer w0.355: U7.1 43.24,62.55 49.91,55.88 49.91,53.43 51.14,52.19 60.64,52.19 61.75,51.08
$1N39259: length 13.1
  Top Layer w0.305: v1(54.98,45.19) 56.28,46.49 ; 56.28,46.49 58.77,48.98 U34.3 ; 56.28,46.49 U2.7
  Bottom Layer w0.406: v1(54.98,45.19) 54.28,44.49 R65.2
$1N39265: length 20.2
  Top Layer w0.406: U8.1 58.48,58.23 TP3.1 ; 58.6,58.11 58.6,55.93 v2(60.4,54.13) ; U34.4 v2(60.4,48.98)
  Bottom Layer w0.406: v2(60.4,48.98) v2(60.4,54.13)
$1N39491: length 11.7
  Top Layer w0.254: U34.1 57.95,50.88 57.3,50.23 57.3,49.23 55.06,46.99 U2.8
  Top Layer w0.305: U2.8 v1(51.2,46.99)
  Bottom Layer w0.406: v1(51.2,46.99) 51.2,48.45 51.35,48.59
$1N39501: length 22.3
  Top Layer w0.305: TP13.1 55.36,53.79 v2(54.6,53.03) ; v2(52.85,51.18) 49.66,47.99 U2.1 v1(47.9,48.83)
  Top Layer w0.406: R62.2 59.35,53.08 57.8,54.63 55.38,54.63 TP13.1
  Bottom Layer w0.305: v2(52.85,51.18) 54.6,52.93 v2(54.6,53.03)
  Bottom Layer w0.406: 49.35,48.59 49.11,48.83 v1(47.9,48.83)
$1N39901: length 21.5
  Top Layer w0.305: 51.3,44.33 49.14,46.49 U2.4
  Top Layer w0.406: TP12.1 59.3,40.27 59.3,42.13 58.63,42.8 R64.2 58.6,44.33 v1(47.6,44.33)
  Bottom Layer w0.406: R65.1 49.15,44.33 v1(47.6,44.33)
$1N41500: length 9.3
  Top Layer w0.305: U35.4 v2(85.3,92.88)
  Bottom Layer w0.305: U32.1 88.8,99.48 88.8,96.38 v2(85.3,92.88)
$2N958: length 4.8
  Top Layer w0.61: FUSE1.2 37.97,21.53 E2.1
$2N1034: length 3
  Top Layer w0.61: R15.2 31.55,21.29
$2N1198: length 6.2
  Top Layer w0.61: FUSE2.1 37.9,30.27 E2.2
$2N1208: length 2.8
  Top Layer w0.61: 28.13,23.91 28.13,21.1
$2N1401: length 4.3
  Top Layer w0.61: E1.2 37.02,95.23 36.94,95.31
$2N1405: length 4
  Top Layer w0.61: E1.1 37.02,84.53 37,84.51
$2N1524: length 2.7
  Top Layer w0.61: LED3.1 30.42,87.03
$2N1645: length 17.5
  Top Layer w0.305: U22.4 34.5,77.93 35.31,78.74 38.39,78.74 39.3,79.65 39.3,82.63 42.1,85.43 E1.5
$2N1650: length 24.6
  Top Layer w0.305: v2(37,80.23) 37,81.63 40.8,85.43 40.8,89.76 E1.6 ; v2(37,77.93) 35.9,77.93 35,77.03 U22.3
  Top Layer w0.406: TP6.1 40.84,94.31 42.1,93.06 E1.6
  Bottom Layer w0.305: v2(37,80.23) v2(37,77.93)
$2N1747: length 24.2
  Top Layer w0.305: U22.5 34,78.23 35.35,79.58 v2(38.2,79.58) ; v2(42.7,84.03) 42.7,81.03 41.25,79.58 v2(40.3,79.58) ; v2(47.2,84.03) 47.18,84.06 E1.9
  Bottom Layer w0.305: v2(42.7,84.03) v2(47.2,84.03)
  Bottom Layer w0.406: v2(38.2,79.58) v2(40.3,79.58)
$2N9413: length 6.7
  Top Layer w0.254: U22.10 U22.9
  Top Layer w0.355: U22.10 37.4,71.33 38,71.93
  Top Layer w0.61: C26.1 38,71.93 38.6,71.33 40.7,71.33
$3N885: length 24.9
  Top Layer w0.406: TP17.1 104.46,19.23 R26.2
  Top Layer w0.61: C22.2 R26.2 99.4,20.83 108.2,29.63 108.2,31.59 108.22,31.6
$3N893: length 24.4
  Top Layer w0.406: 165.79,18.75 165.71,18.83 R25.2
  Top Layer w0.61: v1(162.9,24.03) 159.8,20.93 R25.2 C21.2
  Bottom Layer w0.61: U16.3 165.3,26.43 v1(162.9,24.03)
$3N1446: length 10.4
  Top Layer w0.406: R25.1 159.75,16.79 159.75,15.09 155.15,10.48 U20.1
$3N1590: length 11.4
  Top Layer w0.406: R26.1 v2(99.4,15.53) ; U19.1 94.25,10.48 v2(94.3,10.53)
  Bottom Layer w0.406: v2(94.3,10.53) 99.3,15.53 v2(99.4,15.53)
$3N1744: length 14.7
  Bottom Layer w0.762: U16.5 165.32,76.58 171.75,76.58 173.8,78.63 R27.1
$3N1858: length 14
  Bottom Layer w0.762: R28.1 116.7,79.33 114.2,76.83 108,76.83
$3N7871: length 4.1
  Top Layer w0.406: 142.6,13.33 142.7,13.43 LED4.1
$3N8709: length 16.9
  Top Layer w1.27: DC1.1 108.2,13.63 111.37,16.8 112.03,16.8 115.3,13.53 115.3,12.13 116.41,11.03 U25.1 ; C28.2 111.6,17.03
$3N9005: length 6
  Top Layer w0.61: R36.2 135.4,7.53 134.6,8.33 C18.2
$4N780: length 14
  Top Layer w0.355: U26.3 6.92,29 TP24.1 6.95,23.57 ; U1.1 6.95,23.57 ; 6.95,23.57 9.1,21.42 R51.2 9.15,20.43 C1.2
$4N781: length 16
  Top Layer w0.355: R50.1 4.55,39.59 5.7,38.43 6.45,38.43 R53.1 6.6,38.28 6.6,34.93 TP23.1 6.95,33.81 U26.4 6.95,30.78 6.5,30.33 5.45,30.33 5.05,29.93 U26.1
$4N782: length 11
  Top Layer w0.355: 5.1,16.52 5.12,16.53 8.2,16.53 9.1,17.43 R51.1 10.95,18.98 C1.1 ; 5.1,16.52 5.1,18.28 U1.4 ; 5.1,16.52 R49.2
$4N783: length 15.3
  Top Layer w0.355: 5.1,8.93 10.72,8.93 TP22.1 ; 5.1,8.93 RF1.5 ; 5.1,8.93 5.1,10.48 D1.2 5.1,10.58 R49.1
$4N784: length 60.5
  Top Layer w0.355: R54.2 R50.2 6.05,92.58 5.1,93.53 RF2.5
$4N788: length 2.9
  Top Layer w0.406: U1.3 5.05,21.58 3.95,22.68 R52.2
$4N1883: length 14
  Top Layer w0.355: U27.1 19.85,28.93 ; C34.2 15.65,20.43 R57.2 15.7,21.23 18.08,23.61
$4N1884: length 15.4
  Top Layer w0.355: U28.1 18,29.08 18,30.03 18.4,30.43 19.4,30.43 19.85,30.88 U28.4 19.85,38.24 R56.1 20.5,38.33 21.65,39.49 R59.1
$4N1894: length 9
  Top Layer w0.355: R55.2 17.9,16.75 ; 17.9,16.75 16.68,16.75 15.7,17.73 R57.1 15.65,19.03 C34.1 ; 17.9,16.75 17.9,18.28 U27.4
$4N1895: length 11.9
  Top Layer w0.355: R55.1 17.9,10.58 D2.2 ; D2.2 17.9,10.48 RF3.5 ; D2.2 16.07,10.53 TP26.1
$4N1896: length 63.7
  Top Layer w0.355: RF4.5 17.9,73.93 19.4,72.43 19.4,48.43 15.95,44.98 R60.2 15.95,39.89 17.5,38.33 R56.2
$4N1955: length 6.8
  Top Layer w0.355: U27.3 17.95,19.78 18.7,19.03 18.7,17.88 19.95,16.63 R58.2

## Copper pours and planes (outline as drawn; the poured copper is in the pictures)
AGND on Top Layer: 149.8,64.13 200.1,64.13 200.1,1.53 149.8,1.53
AGND on Top Layer: 1.7,93.23 23,93.23 23,47.03 1.7,47.03
AGND on Top Layer: 85.2,64.13 150,64.13 150,15.13 85.2,15.13
AGND on Top Layer: 86.5,101.43 100.4,101.43 100.4,63.83 86.5,63.83
AGND on Top Layer: 182.5,101.83 200.1,101.83 200.1,63.93 182.5,63.93
AGND on Top Layer: 56.7,31.12 76.13,31.12 76.13,18.29 56.7,18.29
AGND on Top Layer: 39.3,42.37 55.94,42.37 55.94,28.07 39.3,28.07
AGND on Top Layer: 48.57,22.61 55.18,22.61 55.18,10.03 48.57,10.03
AGND on Top Layer: 38.79,70.99 38.79,53.34 49.33,53.34 49.33,55.69 42.73,62.3 42.73,70.87 42.86,70.99
AGND on Top Layer: 125.8,101.83 157.4,101.83 157.4,63.13 125.8,63.13
AGND on Top Layer: 37.97,19.61 49.08,19.61 49.08,6.35 37.97,6.35
AGND on Top Layer: 27.4,64.23 35.9,64.23 35.9,32.93 27.4,32.93
AGND on Bottom Layer: 182.5,101.73 200.05,101.73 200.05,64.44 182.5,64.44
AGND on Bottom Layer: 1.4,102.33 23.7,102.33 23.7,1.23 1.4,1.23
AGND on Bottom Layer: 125.3,101.63 158,101.63 158,64.23 125.3,64.23
AGND on Bottom Layer: 22.9,64.63 25.4,64.63 25.4,7.73 22.9,7.73
AGND on Bottom Layer: 24.44,64.64 200.05,64.64 200.05,1.4 24.44,1.4
AGND on Bottom Layer: 82.2,101.73 100.9,101.73 100.9,64.33 82.2,64.33
DGND on Top Layer: 69.48,84.62 83.5,84.62 83.5,64.64 69.48,64.64
DGND on Top Layer: 56.7,99.13 71.9,99.13 71.9,90.73 56.7,90.73
DGND on Top Layer: 25.84,91.57 32.64,91.57 32.64,69.22 25.84,69.22
DGND on Top Layer: 56.83,74.8 65.84,74.8 65.84,69.09 56.83,69.09
DGND on Bottom Layer: 24.54,101.74 24.54,64.9 41.15,64.9 49.82,55.63 50.07,39.75 50.2,39.62 55.91,39.62 56.04,39.75 56.04,57.91 62.77,64.64 82.07,64.64 82.07,101.74

Small or netless copper shapes (teardrops, artwork), in the pictures only: 1 on Bottom Layer

## Text on the board
Bottom Silkscreen Layer: High Voltage!
Top Silkscreen Layer: DNL | DGND | + | LE | CLK | OBA | OEB | Q | A | SCL | THRA | SDA | THRB | B | D | OBB | CHA | CHB | GND | HVSETA | HVSETB | PET Coincidence and HV | Rev 3 | HV A | HV B | A Out | B Out | TG | 3.3V | 24V | UCSC Physics
